# Altium schematic sheet RK3588-LPDDR4.SchDoc
size 420 x 297 mm; SheetNumber: 16; SheetTotal: 22
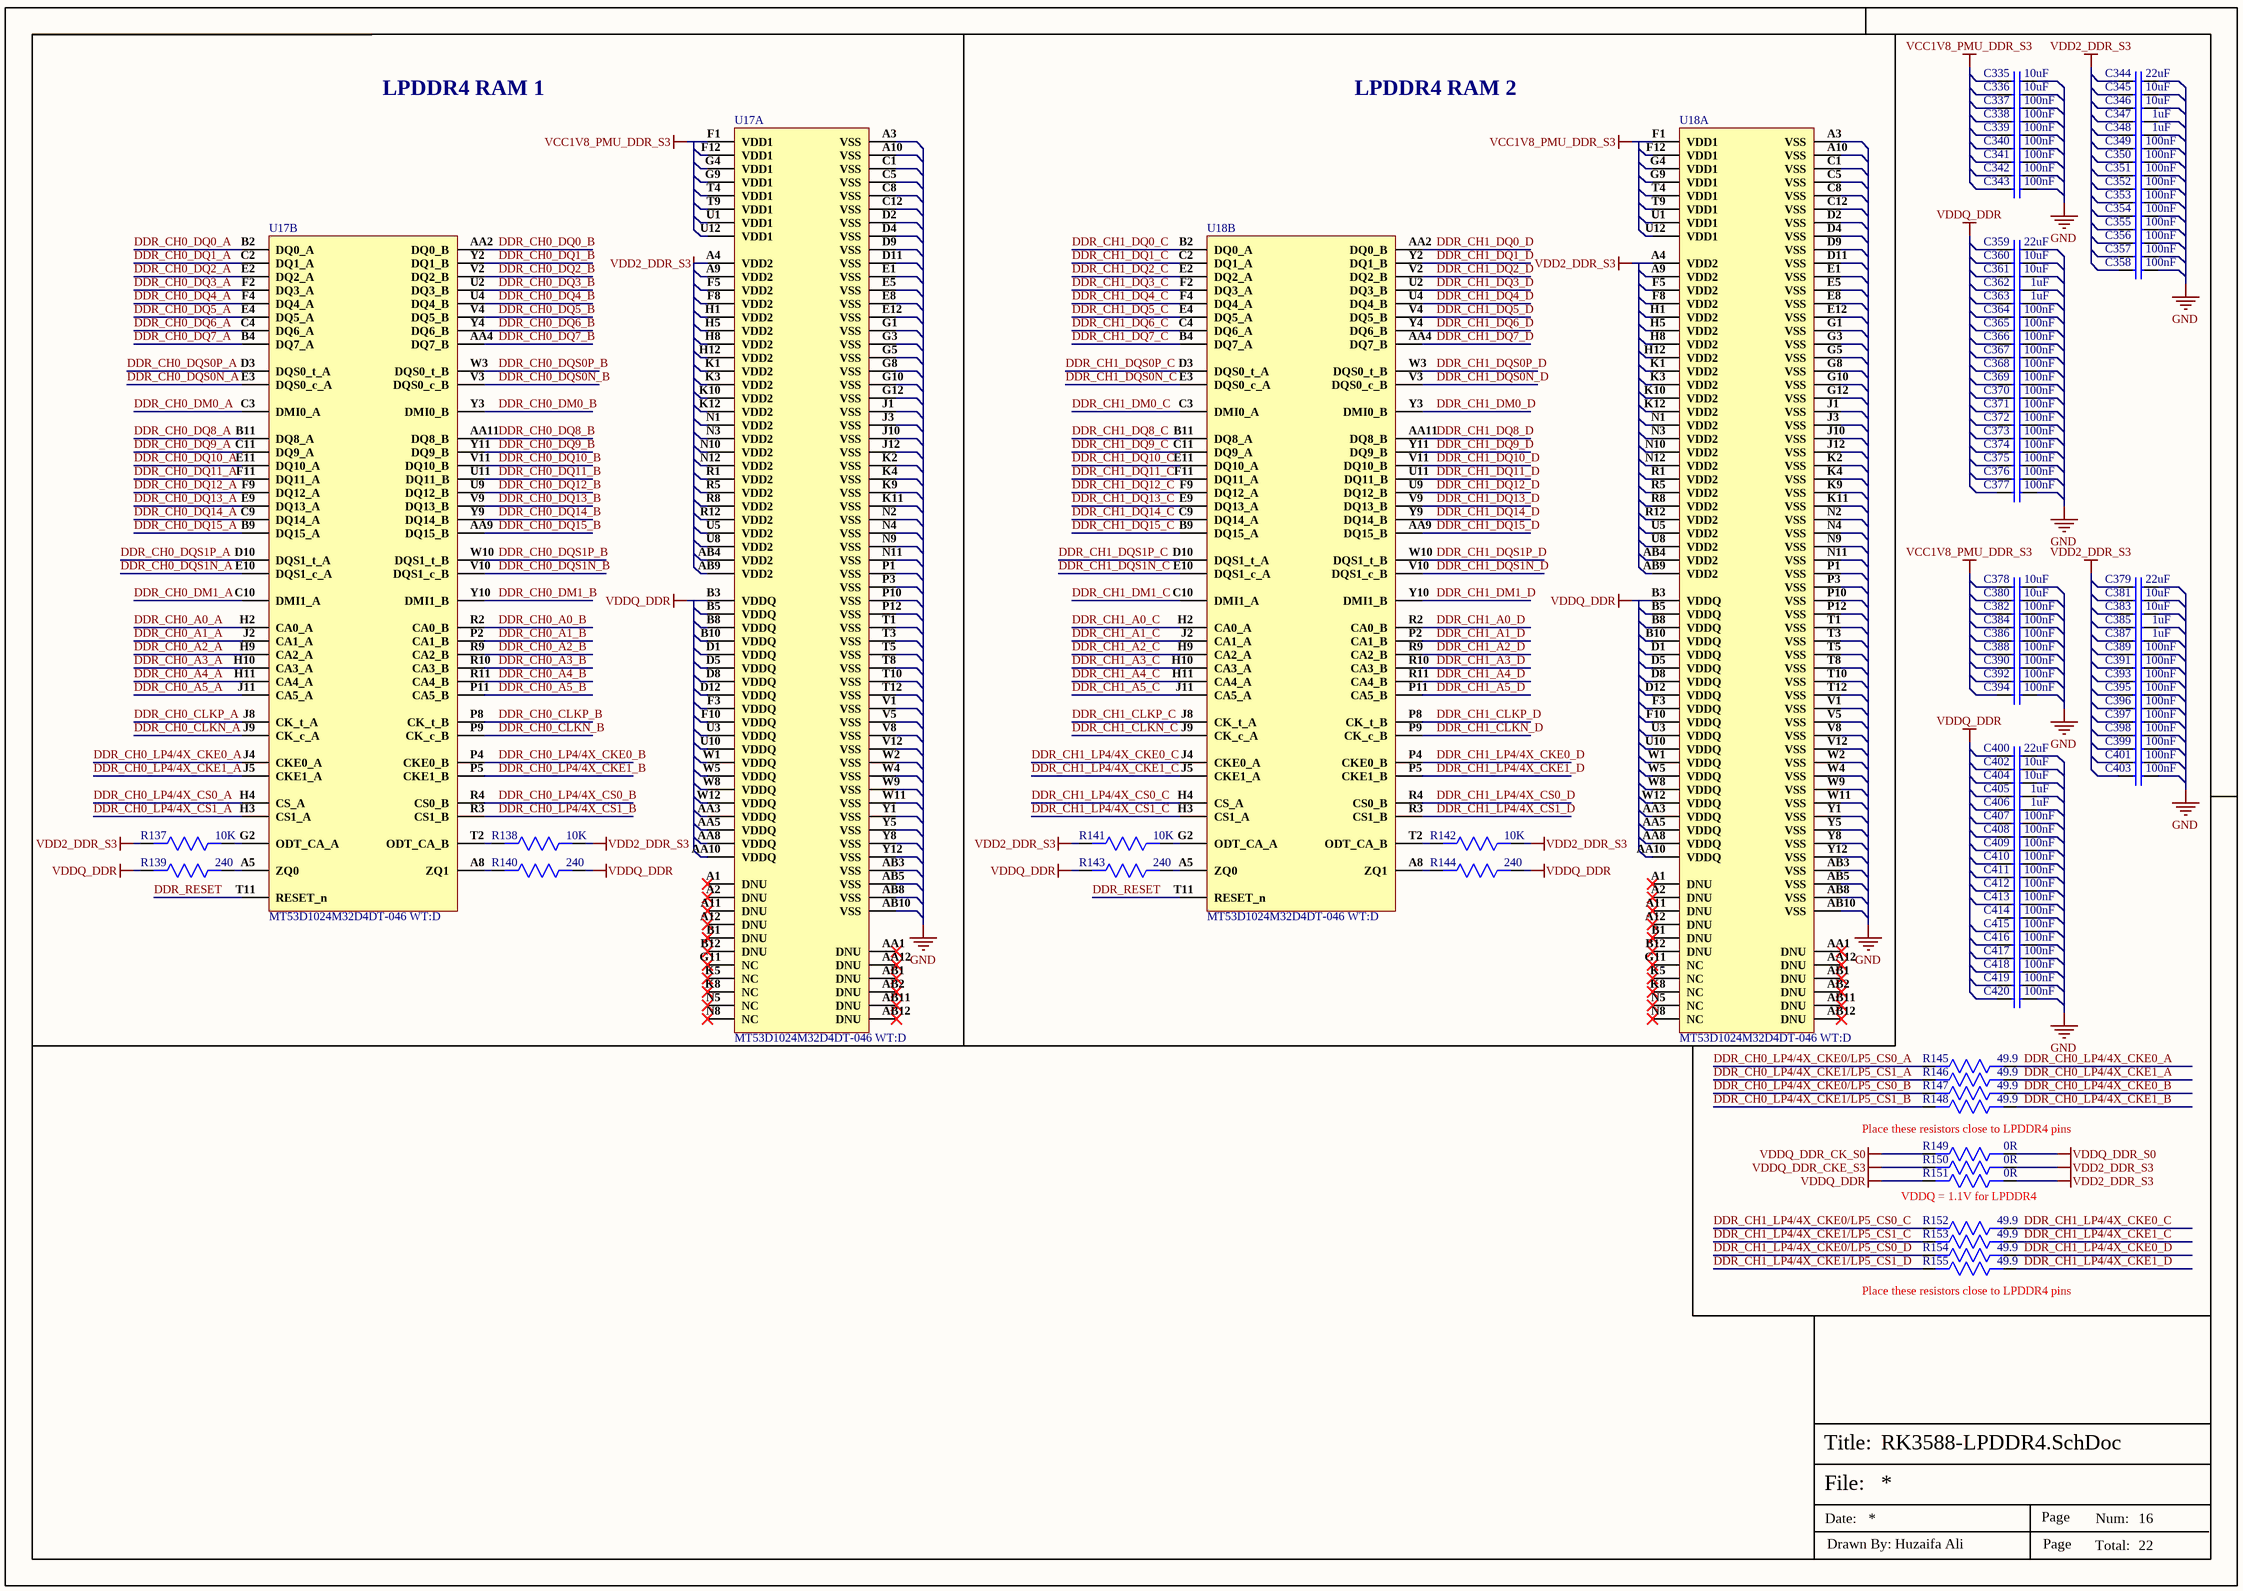
[diagram p0: RK3588-LPDDR4.SchDoc]

## Parts
C335  10uF  [Cap-0603]
C336  10uF  [Cap-0603]
C337  100nF  [CAP-0201]
C338  100nF  [CAP-0201]
C339  100nF  [CAP-0201]
C340  100nF  [CAP-0201]
C341  100nF  [CAP-0201]
C342  100nF  [CAP-0201]
C343  100nF  [CAP-0201]
C344  22uF  [Cap-0603]
C345  10uF  [Cap-0603]
C346  10uF  [Cap-0603]
C347  1uF  [Cap-0402]
C348  1uF  [Cap-0402]
C349  100nF  [CAP-0201]
C350  100nF  [CAP-0201]
C351  100nF  [CAP-0201]
C352  100nF  [CAP-0201]
C353  100nF  [CAP-0201]
C354  100nF  [CAP-0201]
C355  100nF  [CAP-0201]
C356  100nF  [CAP-0201]
C357  100nF  [CAP-0201]
C358  100nF  [CAP-0201]
C359  22uF  [Cap-0603]
C360  10uF  [Cap-0603]
C361  10uF  [Cap-0603]
C362  1uF  [Cap-0402]
C363  1uF  [Cap-0402]
C364  100nF  [CAP-0201]
C365  100nF  [CAP-0201]
C366  100nF  [CAP-0201]
C367  100nF  [CAP-0201]
C368  100nF  [CAP-0201]
C369  100nF  [CAP-0201]
C370  100nF  [CAP-0201]
C371  100nF  [CAP-0201]
C372  100nF  [CAP-0201]
C373  100nF  [CAP-0201]
C374  100nF  [CAP-0201]
C375  100nF  [CAP-0201]
C376  100nF  [CAP-0201]
C377  100nF  [CAP-0201]
C378  10uF  [Cap-0603]
C379  22uF  [Cap-0603]
C380  10uF  [Cap-0603]
C381  10uF  [Cap-0603]
C382  100nF  [CAP-0201]
C383  10uF  [Cap-0603]
C384  100nF  [CAP-0201]
C385  1uF  [Cap-0402]
C386  100nF  [CAP-0201]
C387  1uF  [Cap-0402]
C388  100nF  [CAP-0201]
C389  100nF  [CAP-0201]
C390  100nF  [CAP-0201]
C391  100nF  [CAP-0201]
C392  100nF  [CAP-0201]
C393  100nF  [CAP-0201]
C394  100nF  [CAP-0201]
C395  100nF  [CAP-0201]
C396  100nF  [CAP-0201]
C397  100nF  [CAP-0201]
C398  100nF  [CAP-0201]
C399  100nF  [CAP-0201]
C400  22uF  [Cap-0603]
C401  100nF  [CAP-0201]
C402  10uF  [Cap-0603]
C403  100nF  [CAP-0201]
C404  10uF  [Cap-0603]
C405  1uF  [Cap-0402]
C406  1uF  [Cap-0402]
C407  100nF  [CAP-0201]
C408  100nF  [CAP-0201]
C409  100nF  [CAP-0201]
C410  100nF  [CAP-0201]
C411  100nF  [CAP-0201]
C412  100nF  [CAP-0201]
C413  100nF  [CAP-0201]
C414  100nF  [CAP-0201]
C415  100nF  [CAP-0201]
C416  100nF  [CAP-0201]
C417  100nF  [CAP-0201]
C418  100nF  [CAP-0201]
C419  100nF  [CAP-0201]
C420  100nF  [CAP-0201]
R137  10K  [Res-0201]
R138  10K  [Res-0201]
R139  240  [Res-0201]
R140  240  [Res-0201]
R141  10K  [Res-0201]
R142  10K  [Res-0201]
R143  240  [Res-0201]
R144  240  [Res-0201]
R145  49.9  [Res-0201]
R146  49.9  [Res-0201]
R147  49.9  [Res-0201]
R148  49.9  [Res-0201]
R149  0R  [Res-0805]
R150  0R  [Res-0805]
R151  0R  [Res-0805]
R152  49.9  [Res-0201]
R153  49.9  [Res-0201]
R154  49.9  [Res-0201]
R155  49.9  [Res-0201]
U17  MT53D1024M32D4DT-046 WT:D  [FBGA-200_]  (parts A,B of 2)
U18  MT53D1024M32D4DT-046 WT:D  [FBGA-200_]  (parts A,B of 2)

## Nets
GND: C335.2 C336.2 C337.2 C338.2 C339.2 C340.2 C341.2 C342.2 C343.2 C344.2 C345.2 C346.2 C347.2 C348.2 C349.2 C350.2 C351.2 C352.2 C353.2 C354.2 C355.2 C356.2 C357.2 C358.2 C359.2 C360.2 C361.2 C362.2 C363.2 C364.2 C365.2 C366.2 C367.2 C368.2 C369.2 C370.2 C371.2 C372.2 C373.2 C374.2 C375.2 C376.2 C377.2 C378.2 C379.2 C380.2 C381.2 C382.2 C383.2 C384.2 C385.2 C386.2 C387.2 C388.2 C389.2 C390.2 C391.2 C392.2 C393.2 C394.2 C395.2 C396.2 C397.2 C398.2 C399.2 C400.2 C401.2 C402.2 C403.2 C404.2 C405.2 C406.2 C407.2 C408.2 C409.2 C410.2 C411.2 C412.2 C413.2 C414.2 C415.2 C416.2 C417.2 C418.2 C419.2 C420.2 U17.A3(VSS) U17.A10(VSS) U17.AB3(VSS) U17.AB5(VSS) U17.AB8(VSS) U17.AB10(VSS) U17.C1(VSS) U17.C5(VSS) U17.C8(VSS) U17.C12(VSS) U17.D2(VSS) U17.D4(VSS) U17.D9(VSS) U17.D11(VSS) U17.E1(VSS) U17.E5(VSS) U17.E8(VSS) U17.E12(VSS) U17.G1(VSS) U17.G3(VSS) U17.G5(VSS) U17.G8(VSS) U17.G10(VSS) U17.G12(VSS) U17.J1(VSS) U17.J3(VSS) U17.J10(VSS) U17.J12(VSS) U17.K2(VSS) U17.K4(VSS) U17.K9(VSS) U17.K11(VSS) U17.N2(VSS) U17.N4(VSS) U17.N9(VSS) U17.N11(VSS) U17.P1(VSS) U17.P3(VSS) U17.P10(VSS) U17.P12(VSS) U17.T1(VSS) U17.T3(VSS) U17.T5(VSS) U17.T8(VSS) U17.T10(VSS) U17.T12(VSS) U17.V1(VSS) U17.V5(VSS) U17.V8(VSS) U17.V12(VSS) U17.W2(VSS) U17.W4(VSS) U17.W9(VSS) U17.W11(VSS) U17.Y1(VSS) U17.Y5(VSS) U17.Y8(VSS) U17.Y12(VSS) U18.A3(VSS) U18.A10(VSS) U18.AB3(VSS) U18.AB5(VSS) U18.AB8(VSS) U18.AB10(VSS) U18.C1(VSS) U18.C5(VSS) U18.C8(VSS) U18.C12(VSS) U18.D2(VSS) U18.D4(VSS) U18.D9(VSS) U18.D11(VSS) U18.E1(VSS) U18.E5(VSS) U18.E8(VSS) U18.E12(VSS) U18.G1(VSS) U18.G3(VSS) U18.G5(VSS) U18.G8(VSS) U18.G10(VSS) U18.G12(VSS) U18.J1(VSS) U18.J3(VSS) U18.J10(VSS) U18.J12(VSS) U18.K2(VSS) U18.K4(VSS) U18.K9(VSS) U18.K11(VSS) U18.N2(VSS) U18.N4(VSS) U18.N9(VSS) U18.N11(VSS) U18.P1(VSS) U18.P3(VSS) U18.P10(VSS) U18.P12(VSS) U18.T1(VSS) U18.T3(VSS) U18.T5(VSS) U18.T8(VSS) U18.T10(VSS) U18.T12(VSS) U18.V1(VSS) U18.V5(VSS) U18.V8(VSS) U18.V12(VSS) U18.W2(VSS) U18.W4(VSS) U18.W9(VSS) U18.W11(VSS) U18.Y1(VSS) U18.Y5(VSS) U18.Y8(VSS) U18.Y12(VSS)
VCC1V8_PMU_DDR_S3: C335.1 C336.1 C337.1 C338.1 C339.1 C340.1 C341.1 C342.1 C343.1 C378.1 C380.1 C382.1 C384.1 C386.1 C388.1 C390.1 C392.1 C394.1 U17.F1(VDD1) U17.F12(VDD1) U17.G4(VDD1) U17.G9(VDD1) U17.T4(VDD1) U17.T9(VDD1) U17.U1(VDD1) U17.U12(VDD1) U18.F1(VDD1) U18.F12(VDD1) U18.G4(VDD1) U18.G9(VDD1) U18.T4(VDD1) U18.T9(VDD1) U18.U1(VDD1) U18.U12(VDD1)
VDD2_DDR_S3: C344.1 C345.1 C346.1 C347.1 C348.1 C349.1 C350.1 C351.1 C352.1 C353.1 C354.1 C355.1 C356.1 C357.1 C358.1 C379.1 C381.1 C383.1 C385.1 C387.1 C389.1 C391.1 C393.1 C395.1 C396.1 C397.1 C398.1 C399.1 C401.1 C403.1 R137.2 R138.1 R141.2 R142.1 R150.1 R151.1 U17.A4(VDD2) U17.A9(VDD2) U17.AB4(VDD2) U17.AB9(VDD2) U17.F5(VDD2) U17.F8(VDD2) U17.H1(VDD2) U17.H5(VDD2) U17.H8(VDD2) U17.H12(VDD2) U17.K1(VDD2) U17.K3(VDD2) U17.K10(VDD2) U17.K12(VDD2) U17.N1(VDD2) U17.N3(VDD2) U17.N10(VDD2) U17.N12(VDD2) U17.R1(VDD2) U17.R5(VDD2) U17.R8(VDD2) U17.R12(VDD2) U17.U5(VDD2) U17.U8(VDD2) U18.A4(VDD2) U18.A9(VDD2) U18.AB4(VDD2) U18.AB9(VDD2) U18.F5(VDD2) U18.F8(VDD2) U18.H1(VDD2) U18.H5(VDD2) U18.H8(VDD2) U18.H12(VDD2) U18.K1(VDD2) U18.K3(VDD2) U18.K10(VDD2) U18.K12(VDD2) U18.N1(VDD2) U18.N3(VDD2) U18.N10(VDD2) U18.N12(VDD2) U18.R1(VDD2) U18.R5(VDD2) U18.R8(VDD2) U18.R12(VDD2) U18.U5(VDD2) U18.U8(VDD2)
VDDQ_DDR: C359.1 C360.1 C361.1 C362.1 C363.1 C364.1 C365.1 C366.1 C367.1 C368.1 C369.1 C370.1 C371.1 C372.1 C373.1 C374.1 C375.1 C376.1 C377.1 C400.1 C402.1 C404.1 C405.1 C406.1 C407.1 C408.1 C409.1 C410.1 C411.1 C412.1 C413.1 C415.1 C416.1 C417.1 C418.1 C419.1 C420.1 R139.2 R140.1 R143.2 R144.1 R151.2 U17.AA3(VDDQ) U17.AA5(VDDQ) U17.AA8(VDDQ) U17.AA10(VDDQ) U17.B3(VDDQ) U17.B5(VDDQ) U17.B8(VDDQ) U17.B10(VDDQ) U17.D1(VDDQ) U17.D5(VDDQ) U17.D8(VDDQ) U17.D12(VDDQ) U17.F3(VDDQ) U17.F10(VDDQ) U17.U3(VDDQ) U17.U10(VDDQ) U17.W1(VDDQ) U17.W5(VDDQ) U17.W8(VDDQ) U17.W12(VDDQ) U18.AA3(VDDQ) U18.AA5(VDDQ) U18.AA8(VDDQ) U18.AA10(VDDQ) U18.B3(VDDQ) U18.B5(VDDQ) U18.B8(VDDQ) U18.B10(VDDQ) U18.D1(VDDQ) U18.D5(VDDQ) U18.D8(VDDQ) U18.D12(VDDQ) U18.F3(VDDQ) U18.F10(VDDQ) U18.U3(VDDQ) U18.U10(VDDQ) U18.W1(VDDQ) U18.W5(VDDQ) U18.W8(VDDQ) U18.W12(VDDQ)
VDDQ_DDR_CK_S0: R149.2
VDDQ_DDR_CKE_S3: R150.2
VDDQ_DDR_S0: R149.1
DDR_CH0_A0_A: U17.H2(CA0_A)
DDR_CH0_A0_B: U17.R2(CA0_B)
DDR_CH0_A1_A: U17.J2(CA1_A)
DDR_CH0_A1_B: U17.P2(CA1_B)
DDR_CH0_A2_A: U17.H9(CA2_A)
DDR_CH0_A2_B: U17.R9(CA2_B)
DDR_CH0_A3_A: U17.H10(CA3_A)
DDR_CH0_A3_B: U17.R10(CA3_B)
DDR_CH0_A4_A: U17.H11(CA4_A)
DDR_CH0_A4_B: U17.R11(CA4_B)
DDR_CH0_A5_A: U17.J11(CA5_A)
DDR_CH0_A5_B: U17.P11(CA5_B)
DDR_CH0_CLKN_A: U17.J9(CK_c_A)
DDR_CH0_CLKN_B: U17.P9(CK_c_B)
DDR_CH0_CLKP_A: U17.J8(CK_t_A)
DDR_CH0_CLKP_B: U17.P8(CK_t_B)
DDR_CH0_DM0_A: U17.C3(DMI0_A)
DDR_CH0_DM0_B: U17.Y3(DMI0_B)
DDR_CH0_DM1_A: U17.C10(DMI1_A)
DDR_CH0_DM1_B: U17.Y10(DMI1_B)
DDR_CH0_DQ0_A: U17.B2(DQ0_A)
DDR_CH0_DQ0_B: U17.AA2(DQ0_B)
DDR_CH0_DQ1_A: U17.C2(DQ1_A)
DDR_CH0_DQ1_B: U17.Y2(DQ1_B)
DDR_CH0_DQ2_A: U17.E2(DQ2_A)
DDR_CH0_DQ2_B: U17.V2(DQ2_B)
DDR_CH0_DQ3_A: U17.F2(DQ3_A)
DDR_CH0_DQ3_B: U17.U2(DQ3_B)
DDR_CH0_DQ4_A: U17.F4(DQ4_A)
DDR_CH0_DQ4_B: U17.U4(DQ4_B)
DDR_CH0_DQ5_A: U17.E4(DQ5_A)
DDR_CH0_DQ5_B: U17.V4(DQ5_B)
DDR_CH0_DQ6_A: U17.C4(DQ6_A)
DDR_CH0_DQ6_B: U17.Y4(DQ6_B)
DDR_CH0_DQ7_A: U17.B4(DQ7_A)
DDR_CH0_DQ7_B: U17.AA4(DQ7_B)
DDR_CH0_DQ8_A: U17.B11(DQ8_A)
DDR_CH0_DQ8_B: U17.AA11(DQ8_B)
DDR_CH0_DQ9_A: U17.C11(DQ9_A)
DDR_CH0_DQ9_B: U17.Y11(DQ9_B)
DDR_CH0_DQ10_A: U17.E11(DQ10_A)
DDR_CH0_DQ10_B: U17.V11(DQ10_B)
DDR_CH0_DQ11_A: U17.F11(DQ11_A)
DDR_CH0_DQ11_B: U17.U11(DQ11_B)
DDR_CH0_DQ12_A: U17.F9(DQ12_A)
DDR_CH0_DQ12_B: U17.U9(DQ12_B)
DDR_CH0_DQ13_A: U17.E9(DQ13_A)
DDR_CH0_DQ13_B: U17.V9(DQ13_B)
DDR_CH0_DQ14_A: U17.C9(DQ14_A)
DDR_CH0_DQ14_B: U17.Y9(DQ14_B)
DDR_CH0_DQ15_A: U17.B9(DQ15_A)
DDR_CH0_DQ15_B: U17.AA9(DQ15_B)
DDR_CH0_DQS0N_A: U17.E3(DQS0_c_A)
DDR_CH0_DQS0N_B: U17.V3(DQS0_c_B)
DDR_CH0_DQS0P_A: U17.D3(DQS0_t_A)
DDR_CH0_DQS0P_B: U17.W3(DQS0_t_B)
DDR_CH0_DQS1N_A: U17.E10(DQS1_c_A)
DDR_CH0_DQS1N_B: U17.V10(DQS1_c_B)
DDR_CH0_DQS1P_A: U17.D10(DQS1_t_A)
DDR_CH0_DQS1P_B: U17.W10(DQS1_t_B)
DDR_CH0_LP4/4X_CKE0/LP5_CS0_A: R145.2
DDR_CH0_LP4/4X_CKE0/LP5_CS0_B: R147.2
DDR_CH0_LP4/4X_CKE0_A: R145.1 U17.J4(CKE0_A)
DDR_CH0_LP4/4X_CKE0_B: R147.1 U17.P4(CKE0_B)
DDR_CH0_LP4/4X_CKE1/LP5_CS1_A: R146.2
DDR_CH0_LP4/4X_CKE1/LP5_CS1_B: R148.2
DDR_CH0_LP4/4X_CKE1_A: R146.1 U17.J5(CKE1_A)
DDR_CH0_LP4/4X_CKE1_B: R148.1 U17.P5(CKE1_B)
DDR_CH0_LP4/4X_CS0_A: U17.H4(CS_A)
DDR_CH0_LP4/4X_CS0_B: U17.R4(CS0_B)
DDR_CH0_LP4/4X_CS1_A: U17.H3(CS1_A)
DDR_CH0_LP4/4X_CS1_B: U17.R3(CS1_B)
DDR_CH1_A0_C: U18.H2(CA0_A)
DDR_CH1_A0_D: U18.R2(CA0_B)
DDR_CH1_A1_C: U18.J2(CA1_A)
DDR_CH1_A1_D: U18.P2(CA1_B)
DDR_CH1_A2_C: U18.H9(CA2_A)
DDR_CH1_A2_D: U18.R9(CA2_B)
DDR_CH1_A3_C: U18.H10(CA3_A)
DDR_CH1_A3_D: U18.R10(CA3_B)
DDR_CH1_A4_C: U18.H11(CA4_A)
DDR_CH1_A4_D: U18.R11(CA4_B)
DDR_CH1_A5_C: U18.J11(CA5_A)
DDR_CH1_A5_D: U18.P11(CA5_B)
DDR_CH1_CLKN_C: U18.J9(CK_c_A)
DDR_CH1_CLKN_D: U18.P9(CK_c_B)
DDR_CH1_CLKP_C: U18.J8(CK_t_A)
DDR_CH1_CLKP_D: U18.P8(CK_t_B)
DDR_CH1_DM0_C: U18.C3(DMI0_A)
DDR_CH1_DM0_D: U18.Y3(DMI0_B)
DDR_CH1_DM1_C: U18.C10(DMI1_A)
DDR_CH1_DM1_D: U18.Y10(DMI1_B)
DDR_CH1_DQ0_C: U18.B2(DQ0_A)
DDR_CH1_DQ0_D: U18.AA2(DQ0_B)
DDR_CH1_DQ1_C: U18.C2(DQ1_A)
DDR_CH1_DQ1_D: U18.Y2(DQ1_B)
DDR_CH1_DQ2_C: U18.E2(DQ2_A)
DDR_CH1_DQ2_D: U18.V2(DQ2_B)
DDR_CH1_DQ3_C: U18.F2(DQ3_A)
DDR_CH1_DQ3_D: U18.U2(DQ3_B)
DDR_CH1_DQ4_C: U18.F4(DQ4_A)
DDR_CH1_DQ4_D: U18.U4(DQ4_B)
DDR_CH1_DQ5_C: U18.E4(DQ5_A)
DDR_CH1_DQ5_D: U18.V4(DQ5_B)
DDR_CH1_DQ6_C: U18.C4(DQ6_A)
DDR_CH1_DQ6_D: U18.Y4(DQ6_B)
DDR_CH1_DQ7_C: U18.B4(DQ7_A)
DDR_CH1_DQ7_D: U18.AA4(DQ7_B)
DDR_CH1_DQ8_C: U18.B11(DQ8_A)
DDR_CH1_DQ8_D: U18.AA11(DQ8_B)
DDR_CH1_DQ9_C: U18.C11(DQ9_A)
DDR_CH1_DQ9_D: U18.Y11(DQ9_B)
DDR_CH1_DQ10_C: U18.E11(DQ10_A)
DDR_CH1_DQ10_D: U18.V11(DQ10_B)
DDR_CH1_DQ11_C: U18.F11(DQ11_A)
DDR_CH1_DQ11_D: U18.U11(DQ11_B)
DDR_CH1_DQ12_C: U18.F9(DQ12_A)
DDR_CH1_DQ12_D: U18.U9(DQ12_B)
DDR_CH1_DQ13_C: U18.E9(DQ13_A)
DDR_CH1_DQ13_D: U18.V9(DQ13_B)
DDR_CH1_DQ14_C: U18.C9(DQ14_A)
DDR_CH1_DQ14_D: U18.Y9(DQ14_B)
DDR_CH1_DQ15_C: U18.B9(DQ15_A)
DDR_CH1_DQ15_D: U18.AA9(DQ15_B)
DDR_CH1_DQS0N_C: U18.E3(DQS0_c_A)
DDR_CH1_DQS0N_D: U18.V3(DQS0_c_B)
DDR_CH1_DQS0P_C: U18.D3(DQS0_t_A)
DDR_CH1_DQS0P_D: U18.W3(DQS0_t_B)
DDR_CH1_DQS1N_C: U18.E10(DQS1_c_A)
DDR_CH1_DQS1N_D: U18.V10(DQS1_c_B)
DDR_CH1_DQS1P_C: U18.D10(DQS1_t_A)
DDR_CH1_DQS1P_D: U18.W10(DQS1_t_B)
DDR_CH1_LP4/4X_CKE0/LP5_CS0_C: R152.2
DDR_CH1_LP4/4X_CKE0/LP5_CS0_D: R154.2
DDR_CH1_LP4/4X_CKE0_C: R152.1 U18.J4(CKE0_A)
DDR_CH1_LP4/4X_CKE0_D: R154.1 U18.P4(CKE0_B)
DDR_CH1_LP4/4X_CKE1/LP5_CS1_C: R153.2
DDR_CH1_LP4/4X_CKE1/LP5_CS1_D: R155.2
DDR_CH1_LP4/4X_CKE1_C: R153.1 U18.J5(CKE1_A)
DDR_CH1_LP4/4X_CKE1_D: R155.1 U18.P5(CKE1_B)
DDR_CH1_LP4/4X_CS0_C: U18.H4(CS_A)
DDR_CH1_LP4/4X_CS0_D: U18.R4(CS0_B)
DDR_CH1_LP4/4X_CS1_C: U18.H3(CS1_A)
DDR_CH1_LP4/4X_CS1_D: U18.R3(CS1_B)
DDR_RESET: U17.T11(RESET_n) U18.T11(RESET_n)
NetR137_1: R137.1 U17.G2(ODT_CA_A)
NetR138_2: R138.2 U17.T2(ODT_CA_B)
NetR139_1: R139.1 U17.A5(ZQ0)
NetR140_2: R140.2 U17.A8(ZQ1)
NetR141_1: R141.1 U18.G2(ODT_CA_A)
NetR142_2: R142.2 U18.T2(ODT_CA_B)
NetR143_1: R143.1 U18.A5(ZQ0)
NetR144_2: R144.2 U18.A8(ZQ1)

Not connected (* = marked no-connect by the designer): C414 1; U17 A1(DNU)* A2(DNU)* A11(DNU)* A12(DNU)* AA1(DNU)* AA12(DNU)* AB1(DNU)* AB2(DNU)* AB11(DNU)* AB12(DNU)* B1(DNU)* B12(DNU)* G11(NC)* K5(NC)* K8(NC)* N5(NC)* N8(NC)*; U18 A1(DNU)* A2(DNU)* A11(DNU)* A12(DNU)* AA1(DNU)* AA12(DNU)* AB1(DNU)* AB2(DNU)* AB11(DNU)* AB12(DNU)* B1(DNU)* B12(DNU)* G11(NC)* K5(NC)* K8(NC)* N5(NC)* N8(NC)*

## Notes on the sheet
- LPDDR4 RAM 1
- LPDDR4 RAM 2
- Place these resistors close to LPDDR4 pins
- (near R151) VDDQ = 1.1V for LPDDR4
- (near R155) Place these resistors close to LPDDR4 pins
- File:
- Title:
- Date:
- Page
- Num:
- Total:
- Drawn By: Huzaifa Ali

## Library data of the parts
C335 C378 = CC0603KRX5R6BB106: CAP CER 10UF 10V X5R 0603; Manufacturer: Yageo; Tolerance: 10%; Supplier 1: Digi-Key; Manufacturer Part Number: CC0603KRX5R6BB106; RoHS: Yes; Category: Ceramic Capacitors; Stock 1: 187515; Pricing 1: 1=0.24000, 10=0.16300, 50=0.09780, 100=0.08260, 500=0.05654, 1000=0.05001 (USD); Mount: Surface Mount; Case/Package: 0603; Case Code (Metric): 1608; Case Code (Imperial): 0603; Weight: 7.1E-05oz; Min Operating Temperature: -55°C; Max Operating Temperature: 85°C; Capacitance: 10uF; Packaging: Tape and Reel; Dielectric: X5R; Voltage Rating: 10V; Termination: SMD/SMT; Resistor Type: Ceramic; Voltage Rating (DC): 10V; Package Quantity: 4000; Length: 0.063inch; Width: 0.031inch; Thickness: 0.035inch; Depth: 0.8mm; Lead Free: Lead Free; Halogen Free: Halogen Free; RoHS Compliant: Yes; ComponentLink1URL: http://www.mouser.com/ds/2/447/Yageo_UPY-GP_NP0_16V-to-50V_9-358835.pdf?src-supplier=Mouser; ComponentLink1Description: http://www.mouser.com/ds/2/447/Yageo_UPY-GP_NP0_16V-to-50V_9-358835.pdf?src-supplier=Mouser; ComponentLink2URL: http://www.yageo.com/documents/recent/UPY-GPHC_X5R_4V-to-50V_25.pdf?src-supplier=Digi-Key; ComponentLink2Description: http://www.yageo.com/documents/recent/UPY-GPHC_X5R_4V-to-50V_25.pdf?src-supplier=Digi-Key; Supplier Part Number 1: 311-1782-1-ND; LCSC Part Number: C326057
C336 C345 C346 C360 C361 C380 C381 C383 C402 C404 = GRM188R60J106ME47D: CAP CER 10UF 6.3V X5R 0603; Manufacturer: Murata; Material: Ceramic; Tolerance: 20%; Item Type: Capacitor; Supplier 1: Avnet; Manufacturer Part Number: GRM188R60J106ME47D; RoHS: Yes; Category: Ceramic Capacitors; Stock 1: 513625; Pricing 1: 4000=0.02461, 8000=0.02328, 16000=0.02195, 24000=0.02062, 32000=0.01929, 40000=0.01796, 400000=0.01663 (USD); Mount: Surface Mount; Case/Package: 0603; Case Code (Metric): 1608; Case Code (Imperial): 0603; Weight: 0.000222oz; Min Operating Temperature: -55°C; Max Operating Temperature: 85°C; Capacitance: 10uF; Dielectric: X5R; Packaging: Cut Tape; Package Quantity: 4000; Voltage Rating: 6.3V; Voltage Rating (DC): 6.3V; Termination: Standard; Voltage: 6.3V; Series: GRM; Length: 1.6mm; Width: 0.8mm; Height: 0.8mm; Thickness: 0.035inch; Depth: 0.8mm; Radiation Hardening: No; Reach SVHC Compliant: Yes; Lead Free: Lead Free; RoHS Compliant: Yes; ComponentLink1URL: https://datasheet.ciiva.com/22776/1747457-22776418.pdf?src-supplier=Farnell; ComponentLink1Description: https://datasheet.ciiva.com/22776/1747457-22776418.pdf?src-supplier=Farnell; ComponentLink2URL: https://datasheet.ciiva.com/28584/415295-28584232.pdf?src-supplier=Element14; ComponentLink2Description: https://datasheet.ciiva.com/28584/415295-28584232.pdf?src-supplier=Element14; ComponentLink3URL: https://datasheet.ciiva.com/3777/10175grm188r60j106me4723-3777268.pdf?src-supplier=Arrow+Electronics; ComponentLink3Description: https://datasheet.ciiva.com/3777/10175grm188r60j106me4723-3777268.pdf?src-supplier=Arrow+Electronics; ComponentLink4URL: https://datasheet.ciiva.com/29202/450781-da-01-de-vs-chip-kond-0603-10-0-uf-20pr-6-3v-x5r-29202806.pdf?src-supplier=Conrad; ComponentLink4Description: https://datasheet.ciiva.com/29202/450781-da-01-de-vs-chip-kond-0603-10-0-uf-20pr-6-3v-x5r-29202806.pdf?src-supplier=Conrad; ComponentLink5URL: https://datasheet.ciiva.com/29199/454401-da-01-en-vs-kondensator-0603-29199677.pdf?src-supplier=Conrad; ComponentLink5Description: https://datasheet.ciiva.com/29199/454401-da-01-en-vs-kondensator-0603-29199677.pdf?src-supplier=Conrad; ComponentLink6URL: https://datasheet.ciiva.com/14116/grmseries-highdielectrictype-eng-14116428.pdf?src-supplier=Distrelec; ComponentLink6Description: https://datasheet.ciiva.com/14116/grmseries-highdielectrictype-eng-14116428.pdf?src-supplier=Distrelec; ComponentLink7URL: https://datasheet.ciiva.com/138/partnumbering-e-01-138659.pdf?src-supplier=Digi-Key; ComponentLink7Description: https://datasheet.ciiva.com/138/partnumbering-e-01-138659.pdf?src-supplier=Digi-Key; ComponentLink8URL: https://datasheet.ciiva.com/138/partnumbering-e-01-138658.pdf?src-supplier=Digi-Key; ComponentLink8Description: https://datasheet.ciiva.com/138/partnumbering-e-01-138658.pdf?src-supplier=Digi-Key; ComponentLink9URL: https://datasheet.ciiva.com/138/partnumbering-e-01-138660.pdf?src-supplier=Digi-Key; ComponentLink9Description: https://datasheet.ciiva.com/138/partnumbering-e-01-138660.pdf?src-supplier=Digi-Key; ComponentLink10URL: https://datasheet.ciiva.com/16373/l0005e-16373580.pdf?src-supplier=Future+Electronics; ComponentLink10Description: https://datasheet.ciiva.com/16373/l0005e-16373580.pdf?src-supplier=Future+Electronics; Supplier Part Number 1: GRM188R60J106ME47D; LCSC Part Number: C77041
C337-C343 C349-C358 C364-C377 C382 C384 C386 C388-C399 C401 C403 C407-C420 = CC0201KRX5R6BB104: CAP CER 0.1UF 10V X5R 0201; Manufacturer: Yageo; Tolerance: 10%; Supplier 1: Mouser; Manufacturer Part Number: CC0201KRX5R6BB104; RoHS: Yes; Category: Ceramic Capacitors; Stock 1: 824403; Pricing 1: 1=0.10000, 10=0.02400, 50=0.02400, 100=0.01900, 1000=0.01100, 10000=0.00900 (USD); Mount: Surface Mount; Case/Package: 0201; Case Code (Imperial): 0201; Case Code (Metric): 0603; Weight: 6E-06oz; Min Operating Temperature: -55°C; Max Operating Temperature: 85°C; Capacitance: 100nF; Dielectric: X5R; Voltage Rating (DC): 10V; Packaging: Tape and Reel; Termination: SMD/SMT; Resistor Type: Ceramic; Voltage Rating: 10V; Series: CC; Construction: Flat; Length: 0.6mm; Width: 0.012inch; Height: 0.3mm; Thickness: 0.013inch; Depth: 0.3mm; Radiation Hardening: No; Lead Free: Lead Free; Halogen Free: Halogen Free; RoHS Compliant: Yes; ComponentLink1URL: https://datasheet.ciiva.com/11587/upy-gphc-x5r-4v-to-50v-12-11587190.pdf?src-supplier=Avnet; ComponentLink1Description: https://datasheet.ciiva.com/11587/upy-gphc-x5r-4v-to-50v-12-11587190.pdf?src-supplier=Avnet; Supplier Part Number 1: 603-CC201KRX5R6BB104; LCSC Part Number: C190183
C344 C359 C379 C400 = CC0603MRX5R5BB226: CAP CER 22UF 6.3V X5R 0603; Manufacturer: Yageo; Tolerance: 20%; Supplier 1: Mouser; Manufacturer Part Number: CC0603MRX5R5BB226; RoHS: Yes; Category: Ceramic Capacitors; Stock 1: 3030; Pricing 1: 1=0.33000, 10=0.22500, 50=0.22500, 100=0.12800, 1000=0.07900, 10000=0.06500 (USD); Mount: Surface Mount; Case/Package: 0603; Case Code (Metric): 1608; Case Code (Imperial): 0603; Weight: 7.1E-05oz; Min Operating Temperature: -55°C; Max Operating Temperature: 85°C; Capacitance: 22uF; Packaging: Tape and Reel; Dielectric: X5R; Voltage Rating: 6.3V; Termination: SMD/SMT; Resistor Type: Ceramic; Voltage Rating (DC): 6.3V; Package Quantity: 4000; Length: 0.063inch; Width: 0.031inch; Thickness: 0.035inch; Depth: 0.8mm; Lead Free: Lead Free; Halogen Free: Halogen Free; RoHS Compliant: Yes; ComponentLink1URL: http://www.mouser.com/ds/2/447/Yageo_UPY-GP_NP0_16V-to-50V_9-358835.pdf?src-supplier=Mouser; ComponentLink1Description: http://www.mouser.com/ds/2/447/Yageo_UPY-GP_NP0_16V-to-50V_9-358835.pdf?src-supplier=Mouser; ComponentLink2URL: http://www.yageo.com/documents/recent/UPY-GPHC_X5R_4V-to-50V_25.pdf?src-supplier=Digi-Key; ComponentLink2Description: http://www.yageo.com/documents/recent/UPY-GPHC_X5R_4V-to-50V_25.pdf?src-supplier=Digi-Key; Supplier Part Number 1: 603-CC603MRX5R5BB226; LCSC Part Number: C109448
C347 C348 C362 C363 C385 C387 C405 C406 = CC0402KRX5R6BB105: CAP CER 1UF 10V X5R 0402; Manufacturer: Yageo; Tolerance: 10%; Dissipation Factor: 15%; Supplier 1: Mouser; Manufacturer Part Number: CC0402KRX5R6BB105; RoHS: Yes; Category: Ceramic Capacitors; Stock 1: 6711367; Pricing 1: 1=0.11000, 10=0.05500, 50=0.05500, 100=0.03300, 500=0.02700, 1000=0.02200, 2500=0.02100, 10000=0.01800 (USD); Mount: Surface Mount; Case/Package: 0402; Number of Pins: 2; Case Code (Metric): 1005; Case Code (Imperial): 0402; Min Operating Temperature: -55°C; Max Operating Temperature: 85°C; Capacitance: 1uF; Dielectric: X5R; Package Quantity: 1; Voltage Rating: 10V; Packaging: Tape and Reel; Voltage Rating (DC): 10V; Termination: SMD/SMT; Resistor Type: Ceramic; Series: CC; Construction: Flat; Length: 1mm; Width: 0.02inch; Height: 0.5mm; Thickness: 0.022inch; Depth: 0.5mm; Radiation Hardening: No; REACH SVHC: No SVHC; Lead Free: Lead Free; Halogen Free: Halogen Free; RoHS Compliant: Yes; ComponentLink1URL: https://datasheet.ciiva.com/176/upy-gphc-x5r-4v-to-50v-12-176704.pdf?src-supplier=Digi-Key; ComponentLink1Description: https://datasheet.ciiva.com/176/upy-gphc-x5r-4v-to-50v-12-176704.pdf?src-supplier=Digi-Key; ComponentLink2URL: https://datasheet.ciiva.com/176/mlccorderingcode-176705.pdf?src-supplier=Digi-Key; ComponentLink2Description: https://datasheet.ciiva.com/176/mlccorderingcode-176705.pdf?src-supplier=Digi-Key; ComponentLink3URL: https://datasheet.ciiva.com/176/mlccorderingcode-176706.pdf?src-supplier=Digi-Key; ComponentLink3Description: https://datasheet.ciiva.com/176/mlccorderingcode-176706.pdf?src-supplier=Digi-Key; Supplier Part Number 1: 603-CC402KRX5R6BB105; LCSC Part Number: C106254
R137 R138 R141 R142 = RC0201JR-0710KL: RES SMD 10K OHM 5% 1/20W 0201; Manufacturer: Yageo; Voltage Rating (DC): 25V; Power Rating: 50mW; Resistance: 10kR; Temperature Coefficient: 200ppm/°C; Case Code (Imperial): 0201; Case Code (Metric): 0603; Case/Package: 0201; Category: Chip SMD Resistors; Contact Plating: Tin,Matte; Depth: 0.3mm; Lead Free: Lead Free; Length: 0.6mm; Manufacturer Part Number: RC0201JR-0710KL; Max Operating Temperature: 125°C; Military Standard: Not; Min Operating Temperature: -55°C; Packaging: Tape and Reel; Radiation Hardening: No; REACH SVHC: Unknown; Resistor Type: Thick Film; Termination: SMD/SMT; Tolerance: 5%; Voltage Rating: 25V; ComponentLink1Description: New link; ComponentLink1URL: *; Supplier 1: Digi-Key; RoHS: Yes; Stock 1: 1488597; Pricing 1: 1=0.10000, 10=0.02600, 100=0.01050, 1000=0.00472, 2500=0.00410, 5000=0.00338 (USD); ComponentLink2URL: https://datasheet.ciiva.com/8891/pyu-rc0201-51-rohs-l-8-8891388.pdf?src-supplier=Avnet; ComponentLink2Description: https://datasheet.ciiva.com/8891/pyu-rc0201-51-rohs-l-8-8891388.pdf?src-supplier=Avnet; ComponentLink3URL: https://datasheet.ciiva.com/7672/1563626-7672253.pdf?src-supplier=Element14; ComponentLink3Description: https://datasheet.ciiva.com/7672/1563626-7672253.pdf?src-supplier=Element14; ComponentLink4URL: https://datasheet.ciiva.com/28405/pyu-rc0201-51-rohs-l-8-28405613.pdf?src-supplier=Avnet+Europe; ComponentLink4Description: https://datasheet.ciiva.com/28405/pyu-rc0201-51-rohs-l-8-28405613.pdf?src-supplier=Avnet+Europe; ComponentLink5URL: https://datasheet.ciiva.com/7672/1563626-7672254.pdf?src-supplier=Element14; ComponentLink5Description: https://datasheet.ciiva.com/7672/1563626-7672254.pdf?src-supplier=Element14; ComponentLink6URL: https://datasheet.ciiva.com/7660/1421516-7660810.pdf?src-supplier=Element14; ComponentLink6Description: https://datasheet.ciiva.com/7660/1421516-7660810.pdf?src-supplier=Element14; ComponentLink7URL: https://datasheet.ciiva.com/16856/pyu-rc0201-51-rohs-l-8-16856011.pdf?src-supplier=Avnet+Europe; ComponentLink7Description: https://datasheet.ciiva.com/16856/pyu-rc0201-51-rohs-l-8-16856011.pdf?src-supplier=Avnet+Europe; ComponentLink8URL: https://datasheet.ciiva.com/46391/1421516-46391291.pdf?src-supplier=Element14; ComponentLink8Description: https://datasheet.ciiva.com/46391/1421516-46391291.pdf?src-supplier=Element14; Supplier Part Number 1: 311-10KNCT-ND; LCSC Part Number: C138117
R139 R140 R143 R144 = RC0201FR-07240RL: RES 240 OHM 1% 1/20W 0201; Manufacturer: Yageo; Resistance: 240R; Power Rating: 50mW; Temperature Coefficient: 200ppm/°C; Supplier 1: Digi-Key; Manufacturer Part Number: RC0201FR-07240RL; RoHS: Yes; Category: Chip SMD Resistors; Stock 1: 1077033; Pricing 1: 1=0.10000, 10=0.03700, 100=0.01500, 1000=0.00672, 2500=0.00583, 5000=0.00482 (USD); Mount: Surface Mount; Case/Package: 0201; Case Code (Metric): 0603; Case Code (Imperial): 0201; Min Operating Temperature: -55°C; Max Operating Temperature: 125°C; Tolerance: 1%; Packaging: Tape and Reel; Resistor Type: Thick Film; Number of Terminations: 2; Max Power Dissipation: 50mW; Features: Moisture Resistant; Length: 0.024inch; Width: 0.012inch; Height: 0.01inch; Depth: 0.3mm; Military Standard: Not; Lead Free: Lead Free; RoHS Compliant: Yes; ComponentLink1URL: http://www.yageo.com/documents/recent/PYu-RC0201_51_RoHS_L_(8).pdf?src-supplier=Future+Electronics; ComponentLink1Description: http://www.yageo.com/documents/recent/PYu-RC0201_51_RoHS_L_(8).pdf?src-supplier=Future+Electronics; ComponentLink2URL: http://www.yageo.com/documents/recent/PYu-RC_Group_51_RoHS_L_10.pdf?src-supplier=Digi-Key; ComponentLink2Description: http://www.yageo.com/documents/recent/PYu-RC_Group_51_RoHS_L_10.pdf?src-supplier=Digi-Key; ComponentLink3URL: https://www.yageo.com/upload/media/product/productsearch/datasheet/rchip/PYu-RC_Group_51_RoHS_L_11.pdf?src-supplier=Digi-Key; ComponentLink3Description: https://www.yageo.com/upload/media/product/productsearch/datasheet/rchip/PYu-RC_Group_51_RoHS_L_11.pdf?src-supplier=Digi-Key; ComponentLink4URL: http://www.yageo.com/documents/recent/PYu-RC_Group_51_RoHS_L_9.pdf?src-supplier=Digi-Key; ComponentLink4Description: http://www.yageo.com/documents/recent/PYu-RC_Group_51_RoHS_L_9.pdf?src-supplier=Digi-Key; Supplier Part Number 1: YAG2528CT-ND
R145-R148 R152-R155 = RC0201FR-0749R9L: RES 49.9 OHM 1% 1/20W 0201; Manufacturer: Yageo; Power Rating: 50mW; Resistance: 49.9R; Voltage Rating: 25V; Temperature Coefficient: 200ppm/°C; Supplier 1: Digi-Key; Manufacturer Part Number: RC0201FR-0749R9L; RoHS: Yes; Category: Chip SMD Resistors; Stock 1: 1370024; Pricing 1: 1=0.10000, 10=0.03700, 100=0.01500, 1000=0.00672, 2500=0.00583, 5000=0.00482 (USD); Case/Package: 0201; Case Code (Imperial): 0201; Case Code (Metric): 0603; Size Code: 0201; Min Operating Temperature: -55°C; Max Operating Temperature: 125°C; Packaging: Tape and Reel; Tolerance: 1%; Resistor Type: Thick Film; Number of Terminations: 2; Termination: SMD/SMT; Max Power Dissipation: 50mW; Features: Moisture Resistant; Series: RC; Construction: Rectangular; Length: 0.6mm; Width: 0.012inch; Height: 0.01inch; Depth: 0.3mm; Military Standard: Not; Lead Free: Lead Free; RoHS Compliant: Yes; ComponentLink1URL: http://www.yageo.com/documents/recent/PYu-RC0201_51_RoHS_L_(8).pdf?src-supplier=Mouser; ComponentLink1Description: http://www.yageo.com/documents/recent/PYu-RC0201_51_RoHS_L_(8).pdf?src-supplier=Mouser; ComponentLink2URL: http://www.yageo.com/documents/recent/PYu-RC0201_51_RoHS_L_(8).pdf?src-supplier=Future+Electronics; ComponentLink2Description: http://www.yageo.com/documents/recent/PYu-RC0201_51_RoHS_L_(8).pdf?src-supplier=Future+Electronics; ComponentLink3URL: http://www.yageo.com/documents/recent/PYu-RC_Group_51_RoHS_L_10.pdf?src-supplier=Digi-Key; ComponentLink3Description: http://www.yageo.com/documents/recent/PYu-RC_Group_51_RoHS_L_10.pdf?src-supplier=Digi-Key; ComponentLink4URL: http://www.yageo.com/documents/recent/PYu-RC_Group_51_RoHS_L_9.pdf?src-supplier=Digi-Key; ComponentLink4Description: http://www.yageo.com/documents/recent/PYu-RC_Group_51_RoHS_L_9.pdf?src-supplier=Digi-Key; Supplier Part Number 1: YAG2702CT-ND
R149-R151 = RC0805FR-070RL: RES 0 OHM JUMPER 1/8W 0805; Manufacturer: Yageo; Resistance: 0mR; Tolerance: 1%; Power Rating: 125mW; Item Type: Resistor; Supplier 1: Avnet; Manufacturer Part Number: RC0805FR-070RL; RoHS: Yes; Category: Chip SMD Resistors; Stock 1: 85000; Pricing 1: 5000=0.00281, 10000=0.00277, 20000=0.00269 (USD); Case/Package: 0805; Contact Plating: Tin,Matte; Case Code (Imperial): 0805; Case Code (Metric): 2012; Size Code: 0805; Min Operating Temperature: -55°C; Max Operating Temperature: 155°C; Resistor Type: Thick Film; Packaging: Tape and Reel; Features: Moisture Resistant; Series: RC; Max Power Dissipation: 125mW; Number of Terminations: 2; Construction: Rectangular; Length: 2mm; Depth: 1.25mm; Radiation Hardening: No; Military Standard: Not; Lead Free: Lead Free; RoHS Compliant: Yes; ComponentLink1URL: https://datasheet.ciiva.com/15189/getdatasheetpartid-348154-15189885.pdf?src-supplier=Verical; ComponentLink1Description: https://datasheet.ciiva.com/15189/getdatasheetpartid-348154-15189885.pdf?src-supplier=Verical; ComponentLink2URL: https://datasheet.ciiva.com/17042/rc0805-17042698.pdf?src-supplier=Future+Electronics; ComponentLink2Description: https://datasheet.ciiva.com/17042/rc0805-17042698.pdf?src-supplier=Future+Electronics; Supplier Part Number 1: RC0805FR-070RL; LCSC Part Number: C100045
U17 U18 = MT53D1024M32D4DT-046 WT:D: VFBGA-200 DDR SDRAM ROHS; Manufacturer: Micron Tech; Item Type: IC; Manufacturer Part Number: MT53D1024M32D4DT-046 WT:D; Package: VFBGA-200; LCSC Part Number: C907715; ComponentLink1Description: LCSC; ComponentLink1URL: https://lcsc.com/product-detail/DDR-SDRAM_Micron-Tech-MT53D1024M32D4DT-046-WT-D_C907715.html